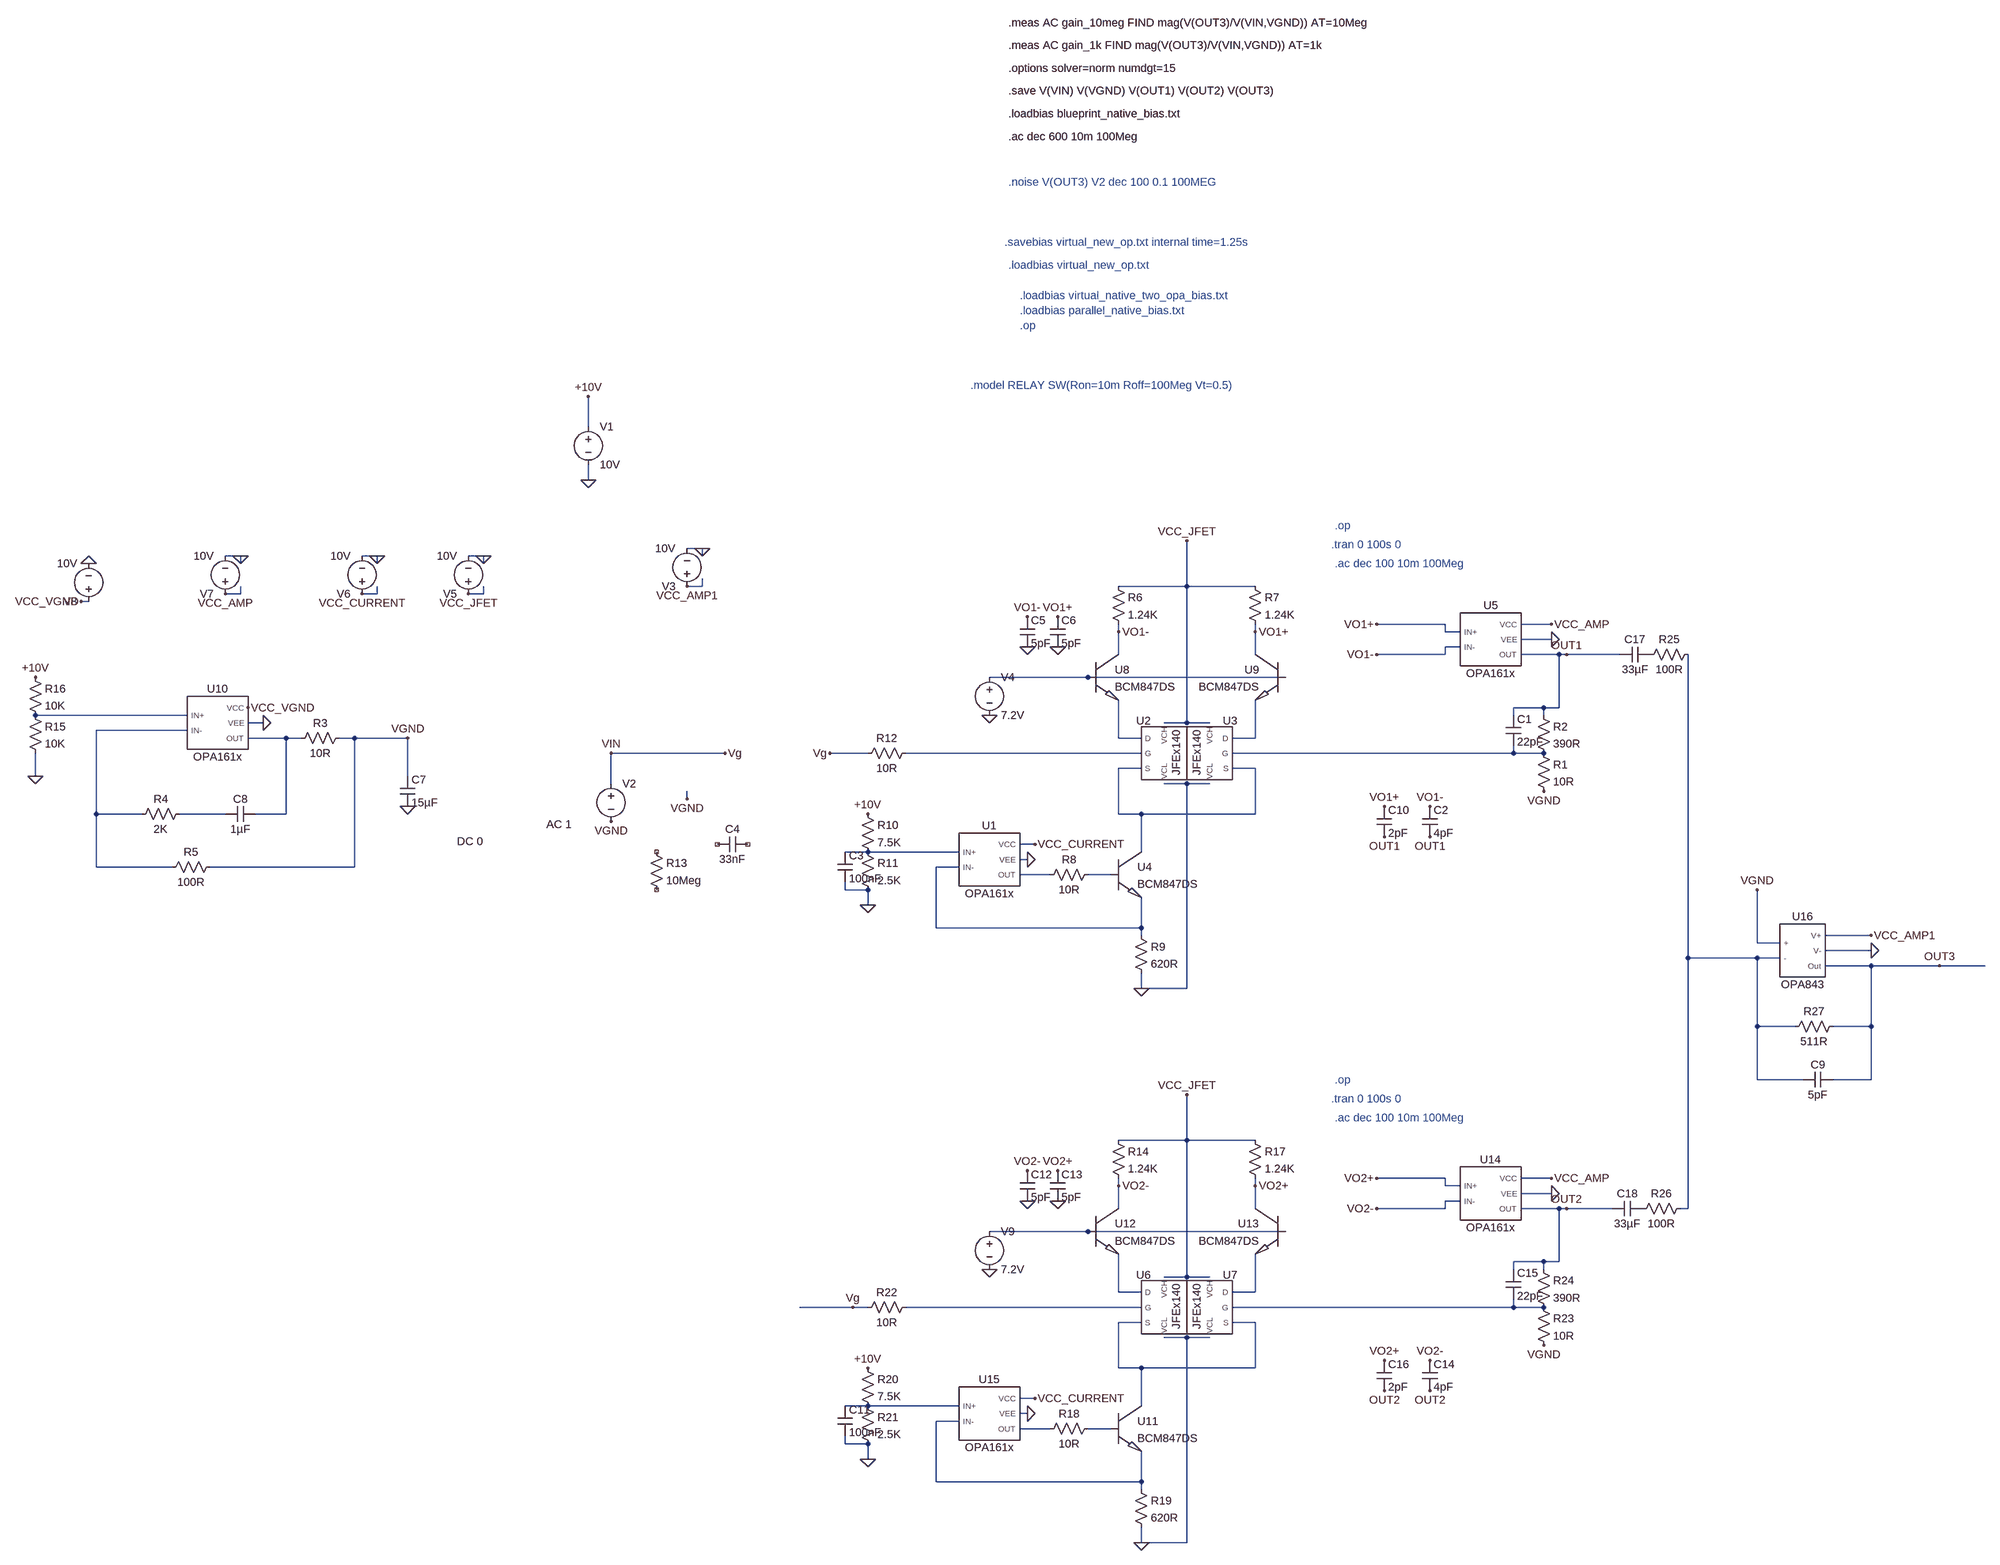
[diagram p0: schematic blueprint_bias_AC.asc]
blueprint_bias_AC.asc, the LTspice schematic file:
Version 4.1
SHEET 1 1684 2100
WIRE -1888 -272 -1888 -336
WIRE -1888 -160 -1888 -192
WIRE -1648 -16 -1680 -16
WIRE -2704 0 -2736 0
WIRE -2416 0 -2448 0
WIRE -2192 0 -2224 0
WIRE -1648 0 -1648 -16
WIRE -2704 16 -2704 0
WIRE -2416 16 -2416 0
WIRE -2192 16 -2192 0
WIRE -1648 64 -1648 48
WIRE -1648 64 -1680 64
WIRE -592 64 -592 -32
WIRE -592 64 -736 64
WIRE -448 64 -592 64
WIRE -2704 80 -2704 64
WIRE -2704 80 -2736 80
WIRE -2416 80 -2416 64
WIRE -2416 80 -2448 80
WIRE -2192 80 -2192 64
WIRE -2192 80 -2224 80
WIRE -3024 96 -3040 96
WIRE -48 144 -192 144
WIRE 176 144 112 144
WIRE -736 160 -736 144
WIRE -448 160 -448 144
WIRE -48 160 -48 144
WIRE -16 160 -48 160
WIRE 176 176 112 176
WIRE -16 192 -48 192
WIRE -736 208 -736 160
WIRE -448 208 -448 160
WIRE -48 208 -48 192
WIRE -48 208 -192 208
WIRE 192 208 112 208
WIRE 208 208 192 208
WIRE 320 208 208 208
WIRE -800 256 -1008 256
WIRE -384 256 -800 256
WIRE 160 320 96 320
WIRE 192 320 192 208
WIRE 192 320 160 320
WIRE -2816 336 -3136 336
WIRE 96 336 96 320
WIRE 160 336 160 320
WIRE -2656 352 -2688 352
WIRE -592 352 -592 64
WIRE -592 352 -640 352
WIRE -544 352 -592 352
WIRE -2816 368 -3008 368
WIRE -2608 384 -2688 384
WIRE -2576 384 -2608 384
WIRE -2464 384 -2496 384
WIRE -2352 384 -2464 384
WIRE -736 384 -736 304
WIRE -688 384 -736 384
WIRE -448 384 -448 304
WIRE -448 384 -496 384
WIRE -1600 416 -1840 416
WIRE -1264 416 -1344 416
WIRE -688 416 -1184 416
WIRE 96 416 96 400
WIRE 96 416 -496 416
WIRE 160 416 96 416
WIRE -688 448 -736 448
WIRE -448 448 -496 448
WIRE -3136 464 -3136 416
WIRE -2352 464 -2352 384
WIRE -1840 480 -1840 416
WIRE -592 480 -640 480
WIRE -544 480 -592 480
WIRE -1680 512 -1680 496
WIRE -3008 544 -3008 368
WIRE -2912 544 -3008 544
WIRE -2736 544 -2832 544
WIRE -2608 544 -2608 384
WIRE -2608 544 -2672 544
WIRE -736 544 -736 448
WIRE -688 544 -736 544
WIRE -448 544 -448 448
WIRE -448 544 -688 544
WIRE -912 608 -944 608
WIRE -1264 624 -1312 624
WIRE -1072 624 -1264 624
WIRE -688 624 -688 544
WIRE -928 640 -944 640
WIRE -3008 656 -3008 544
WIRE -2848 656 -3008 656
WIRE -2464 656 -2464 384
WIRE -2464 656 -2768 656
WIRE -1072 656 -1120 656
WIRE -880 672 -944 672
WIRE -752 672 -800 672
WIRE -1312 704 -1312 688
WIRE -1264 704 -1312 704
WIRE -1264 736 -1264 704
WIRE -1120 784 -1120 656
WIRE -688 784 -688 720
WIRE -688 784 -1120 784
WIRE -688 800 -688 784
WIRE 896 800 800 800
WIRE 656 816 656 704
WIRE 704 816 656 816
WIRE 896 832 800 832
WIRE 464 848 464 208
WIRE 656 848 464 848
WIRE 704 848 656 848
WIRE 896 864 800 864
WIRE 1040 864 896 864
WIRE 1136 864 1040 864
WIRE -688 912 -688 880
WIRE -592 912 -592 480
WIRE -592 912 -688 912
WIRE 656 992 656 848
WIRE 736 992 656 992
WIRE 896 992 896 864
WIRE 896 992 816 992
WIRE 656 1104 656 992
WIRE 752 1104 656 1104
WIRE 896 1104 896 992
WIRE 896 1104 816 1104
WIRE -592 1232 -592 1136
WIRE -592 1232 -736 1232
WIRE -448 1232 -592 1232
WIRE -48 1312 -192 1312
WIRE 176 1312 112 1312
WIRE -736 1328 -736 1312
WIRE -448 1328 -448 1312
WIRE -48 1328 -48 1312
WIRE -16 1328 -48 1328
WIRE 176 1344 112 1344
WIRE -16 1360 -48 1360
WIRE -736 1376 -736 1328
WIRE -448 1376 -448 1328
WIRE -48 1376 -48 1360
WIRE -48 1376 -192 1376
WIRE 192 1376 112 1376
WIRE 208 1376 192 1376
WIRE 304 1376 208 1376
WIRE 464 1376 464 848
WIRE 464 1376 448 1376
WIRE -800 1424 -1008 1424
WIRE -384 1424 -800 1424
WIRE 160 1488 96 1488
WIRE 192 1488 192 1376
WIRE 192 1488 160 1488
WIRE 96 1504 96 1488
WIRE 160 1504 160 1488
WIRE -592 1520 -592 1232
WIRE -592 1520 -640 1520
WIRE -544 1520 -592 1520
WIRE -736 1552 -736 1472
WIRE -688 1552 -736 1552
WIRE -448 1552 -448 1472
WIRE -448 1552 -496 1552
WIRE -1296 1584 -1408 1584
WIRE -1264 1584 -1296 1584
WIRE -688 1584 -1184 1584
WIRE 96 1584 96 1568
WIRE 96 1584 -496 1584
WIRE 160 1584 96 1584
WIRE -688 1616 -736 1616
WIRE -448 1616 -496 1616
WIRE -592 1648 -640 1648
WIRE -544 1648 -592 1648
WIRE -736 1712 -736 1616
WIRE -688 1712 -736 1712
WIRE -448 1712 -448 1616
WIRE -448 1712 -688 1712
WIRE -912 1776 -944 1776
WIRE -1264 1792 -1312 1792
WIRE -1072 1792 -1264 1792
WIRE -688 1792 -688 1712
WIRE -928 1808 -944 1808
WIRE -1072 1824 -1120 1824
WIRE -880 1840 -944 1840
WIRE -752 1840 -800 1840
WIRE -1312 1872 -1312 1856
WIRE -1264 1872 -1312 1872
WIRE -1264 1904 -1264 1872
WIRE -1120 1952 -1120 1824
WIRE -688 1952 -688 1888
WIRE -688 1952 -1120 1952
WIRE -688 1968 -688 1952
WIRE -688 2080 -688 2048
WIRE -592 2080 -592 1648
WIRE -592 2080 -688 2080
FLAG -1888 -160 0
FLAG -1888 -336 +10V
FLAG -688 912 0
FLAG -1264 736 0
FLAG -1264 544 +10V
FLAG -928 640 0
FLAG -736 160 VO1-
FLAG -448 160 VO1+
FLAG -1680 512 VGND
FLAG -1840 416 VIN
FLAG -928 128 VO1-
FLAG -928 192 0
FLAG -864 128 VO1+
FLAG -864 192 0
FLAG -1008 336 0
FLAG -192 208 VO1-
FLAG -192 144 VO1+
FLAG -80 528 VO1-
FLAG 208 208 OUT1
FLAG -80 592 OUT1
FLAG 176 176 0
FLAG 160 496 VGND
FLAG 176 144 VCC_AMP
FLAG -2736 80 VCC_AMP
FLAG -2448 80 VCC_CURRENT
FLAG -2224 80 VCC_JFET
FLAG -592 -32 VCC_JFET
FLAG -912 608 VCC_CURRENT
FLAG -2704 0 0
FLAG -2416 0 0
FLAG -2192 0 0
FLAG -1840 560 VGND
FLAG -2352 528 0
FLAG -3040 96 VCC_VGND
FLAG -3024 16 0
FLAG -2688 320 VCC_VGND
FLAG -2656 352 0
FLAG -3136 464 0
FLAG -3136 256 +10V
FLAG -176 592 OUT1
FLAG -176 528 VO1+
FLAG -688 2080 0
FLAG -1264 1904 0
FLAG -1264 1712 +10V
FLAG -928 1808 0
FLAG -736 1328 VO2-
FLAG -448 1328 VO2+
FLAG -1296 1584 Vg
FLAG -928 1296 VO2-
FLAG -928 1360 0
FLAG -864 1296 VO2+
FLAG -864 1360 0
FLAG -1008 1504 0
FLAG -192 1376 VO2-
FLAG -192 1312 VO2+
FLAG -80 1696 VO2-
FLAG 208 1376 OUT2
FLAG -80 1760 OUT2
FLAG 176 1344 0
FLAG 160 1664 VGND
FLAG 176 1312 VCC_AMP
FLAG -592 1136 VCC_JFET
FLAG -912 1776 VCC_CURRENT
FLAG -176 1760 OUT2
FLAG -176 1696 VO2+
FLAG -1600 416 Vg
FLAG -1344 416 Vg
FLAG 656 704 VGND
FLAG 896 832 0
FLAG 1040 864 OUT3
FLAG -1680 64 VCC_AMP1
FLAG -1648 -16 0
FLAG 896 800 VCC_AMP1
FLAG -2352 384 VGND
SYMBOL voltage -1888 -288 R0
WINDOW 123 0 0 Left 0
WINDOW 39 0 0 Left 0
SYMATTR InstName V1
SYMATTR Value 10V
SYMBOL JFEx140 -640 416 R0
SYMATTR InstName U2
SYMBOL JFEx140 -544 416 M0
SYMATTR InstName U3
SYMBOL res -752 48 R0
SYMATTR InstName R6
SYMATTR Value 1.24K
SYMBOL res -464 48 R0
SYMATTR InstName R7
SYMATTR Value 1.24K
SYMBOL BCM847DS -752 624 R0
SYMATTR InstName U4
SYMBOL res -784 656 R90
WINDOW 0 0 56 VBottom 2
WINDOW 3 32 56 VTop 2
SYMATTR InstName R8
SYMATTR Value 10R
SYMBOL res -704 784 R0
SYMATTR InstName R9
SYMATTR Value 620R
SYMBOL res -1280 528 R0
SYMATTR InstName R10
SYMATTR Value 7.5K
SYMBOL res -1280 608 R0
SYMATTR InstName R11
SYMATTR Value 2.5K
SYMBOL cap -1328 624 R0
SYMATTR InstName C3
SYMATTR Value 100nF
SYMBOL res -1168 400 R90
WINDOW 0 0 56 VBottom 2
WINDOW 3 32 56 VTop 2
SYMATTR InstName R12
SYMATTR Value 10R
SYMBOL voltage -1840 464 R0
WINDOW 3 -408 138 Left 2
WINDOW 123 -136 102 Left 2
WINDOW 39 0 0 Left 0
SYMATTR Value DC 0
SYMATTR Value2 AC 1
SYMATTR InstName V2
SYMBOL cap -1552 592 R90
WINDOW 0 0 32 VBottom 2
WINDOW 3 32 32 VTop 2
SYMATTR InstName C4
SYMATTR Value 33nF
SYMATTR SpiceLine V=5V
SYMBOL res -1760 608 R0
SYMATTR InstName R13
SYMATTR Value 10Meg
SYMBOL cap -944 128 R0
SYMATTR InstName C5
SYMATTR Value 5pF
SYMBOL cap -880 128 R0
SYMATTR InstName C6
SYMATTR Value 5pF
SYMBOL BCM847DS -800 208 R0
SYMATTR InstName U8
SYMBOL BCM847DS -384 208 M0
SYMATTR InstName U9
SYMBOL voltage -1008 240 R0
WINDOW 123 0 0 Left 0
WINDOW 39 0 0 Left 0
SYMATTR InstName V4
SYMATTR Value 7.2V
SYMBOL OPA161x 48 176 R0
SYMATTR InstName U5
SYMBOL cap -96 528 R0
SYMATTR InstName C2
SYMATTR Value 4pF
SYMBOL res 144 400 R0
SYMATTR InstName R1
SYMATTR Value 10R
SYMBOL res 144 320 R0
SYMATTR InstName R2
SYMATTR Value 390R
SYMBOL cap 80 336 R0
SYMATTR InstName C1
SYMATTR Value 22pF
SYMBOL OPA161x -1008 640 R0
SYMATTR InstName U1
SYMBOL OPA161x -2752 352 R0
SYMATTR InstName U10
SYMBOL res -2480 368 R90
WINDOW 0 0 56 VBottom 2
WINDOW 3 32 56 VTop 2
SYMATTR InstName R3
SYMATTR Value 10R
SYMBOL cap -2368 464 R0
SYMATTR InstName C7
SYMATTR Value 15µF
SYMATTR SpiceLine Rser=10mR Lser=1nH
SYMBOL cap -2672 528 R90
WINDOW 0 0 32 VBottom 2
WINDOW 3 32 32 VTop 2
SYMATTR InstName C8
SYMATTR Value 1µF
SYMBOL res -2816 528 R90
WINDOW 0 0 56 VBottom 2
WINDOW 3 32 56 VTop 2
SYMATTR InstName R4
SYMATTR Value 2K
SYMBOL res -2752 640 R90
WINDOW 0 0 56 VBottom 2
WINDOW 3 32 56 VTop 2
SYMATTR InstName R5
SYMATTR Value 100R
SYMBOL res -3152 320 R0
SYMATTR InstName R15
SYMATTR Value 10K
SYMBOL res -3152 240 R0
SYMATTR InstName R16
SYMATTR Value 10K
SYMBOL cap -192 528 R0
SYMATTR InstName C10
SYMATTR Value 2pF
SYMBOL JFEx140 -640 1584 R0
SYMATTR InstName U6
SYMBOL JFEx140 -544 1584 M0
SYMATTR InstName U7
SYMBOL res -752 1216 R0
SYMATTR InstName R14
SYMATTR Value 1.24K
SYMBOL res -464 1216 R0
SYMATTR InstName R17
SYMATTR Value 1.24K
SYMBOL BCM847DS -752 1792 R0
SYMATTR InstName U11
SYMBOL res -784 1824 R90
WINDOW 0 0 56 VBottom 2
WINDOW 3 32 56 VTop 2
SYMATTR InstName R18
SYMATTR Value 10R
SYMBOL res -704 1952 R0
SYMATTR InstName R19
SYMATTR Value 620R
SYMBOL res -1280 1696 R0
SYMATTR InstName R20
SYMATTR Value 7.5K
SYMBOL res -1280 1776 R0
SYMATTR InstName R21
SYMATTR Value 2.5K
SYMBOL cap -1328 1792 R0
SYMATTR InstName C11
SYMATTR Value 100nF
SYMBOL res -1168 1568 R90
WINDOW 0 0 56 VBottom 2
WINDOW 3 32 56 VTop 2
SYMATTR InstName R22
SYMATTR Value 10R
SYMBOL cap -944 1296 R0
SYMATTR InstName C12
SYMATTR Value 5pF
SYMBOL cap -880 1296 R0
SYMATTR InstName C13
SYMATTR Value 5pF
SYMBOL BCM847DS -800 1376 R0
SYMATTR InstName U12
SYMBOL BCM847DS -384 1376 M0
SYMATTR InstName U13
SYMBOL voltage -1008 1408 R0
WINDOW 123 0 0 Left 0
WINDOW 39 0 0 Left 0
SYMATTR InstName V9
SYMATTR Value 7.2V
SYMBOL OPA161x 48 1344 R0
SYMATTR InstName U14
SYMBOL cap -96 1696 R0
SYMATTR InstName C14
SYMATTR Value 4pF
SYMBOL res 144 1568 R0
SYMATTR InstName R23
SYMATTR Value 10R
SYMBOL res 144 1488 R0
SYMATTR InstName R24
SYMATTR Value 390R
SYMBOL cap 80 1504 R0
SYMATTR InstName C15
SYMATTR Value 22pF
SYMBOL OPA161x -1008 1808 R0
SYMATTR InstName U15
SYMBOL cap -192 1696 R0
SYMATTR InstName C16
SYMATTR Value 2pF
SYMBOL cap 384 192 R90
WINDOW 0 0 32 VBottom 2
WINDOW 3 32 32 VTop 2
SYMATTR InstName C17
SYMATTR Value 33µF
SYMBOL res 480 192 R90
WINDOW 0 0 56 VBottom 2
WINDOW 3 32 56 VTop 2
SYMATTR InstName R25
SYMATTR Value 100R
SYMBOL cap 368 1360 R90
WINDOW 0 0 32 VBottom 2
WINDOW 3 32 32 VTop 2
SYMATTR InstName C18
SYMATTR Value 33µF
SYMBOL res 464 1360 R90
WINDOW 0 0 56 VBottom 2
WINDOW 3 32 56 VTop 2
SYMATTR InstName R26
SYMATTR Value 100R
SYMBOL res 832 976 R90
WINDOW 0 0 56 VBottom 2
WINDOW 3 32 56 VTop 2
SYMATTR InstName R27
SYMATTR Value 511R
SYMBOL voltage -1680 80 R180
WINDOW 123 0 0 Left 0
WINDOW 39 0 0 Left 0
SYMATTR InstName V3
SYMATTR Value 10V
SYMBOL voltage -2224 96 R180
WINDOW 123 0 0 Left 0
WINDOW 39 0 0 Left 0
SYMATTR InstName V5
SYMATTR Value 10V
SYMBOL voltage -2448 96 R180
WINDOW 123 0 0 Left 0
WINDOW 39 0 0 Left 0
SYMATTR InstName V6
SYMATTR Value 10V
SYMBOL voltage -2736 96 R180
WINDOW 123 0 0 Left 0
WINDOW 39 0 0 Left 0
SYMATTR InstName V7
SYMATTR Value 10V
SYMBOL voltage -3024 112 R180
WINDOW 123 0 0 Left 0
WINDOW 39 0 0 Left 0
SYMATTR InstName V8
SYMATTR Value 10V
SYMBOL OPA843 752 832 R0
SYMATTR InstName U16
SYMBOL cap 816 1088 R90
WINDOW 0 0 32 VBottom 2
WINDOW 3 32 32 VTop 2
SYMATTR InstName C9
SYMATTR Value 5pF
TEXT -280 16 Left 2 ;.ac dec 100 10m 100Meg
TEXT -288 -24 Left 2 ;.tran 0 100s 0
TEXT -280 -64 Left 2 ;.op
TEXT -976 -688 Left 2 ;.savebias virtual_new_op.txt internal time=1.25s
TEXT -968 -640 Left 2 ;.loadbias virtual_new_op.txt
TEXT -944 -512 Left 2 ;.op
TEXT -944 -576 Left 2 ;.loadbias virtual_native_two_opa_bias.txt
TEXT -1048 -360 Left 2 ;.model RELAY SW(Ron=10m Roff=100Meg Vt=0.5)
TEXT -968 -840 Left 2 ;.noise V(OUT3) V2 dec 100 0.1 100MEG
TEXT -944 -544 Left 2 ;.loadbias parallel_native_bias.txt
TEXT -280 1184 Left 2 ;.ac dec 100 10m 100Meg
TEXT -288 1144 Left 2 ;.tran 0 100s 0
TEXT -280 1104 Left 2 ;.op
TEXT -968 -936 Left 2 !.ac dec 600 10m 100Meg
TEXT -968 -984 Left 2 !.loadbias blueprint_native_bias.txt
TEXT -968 -1032 Left 2 !.save V(VIN) V(VGND) V(OUT1) V(OUT2) V(OUT3)
TEXT -968 -1080 Left 2 !.options solver=norm numdgt=15
TEXT -968 -1128 Left 2 !.meas AC gain_1k FIND mag(V(OUT3)/V(VIN,VGND)) AT=1k
TEXT -968 -1176 Left 2 !.meas AC gain_10meg FIND mag(V(OUT3)/V(VIN,VGND)) AT=10Meg

The netlist it stands for:
* blueprint_bias_AC.asc
V1 +10V 0 10V
X§U2 N005 N007 N009 VCC_JFET 0 JFEx140  ; pins D G S VCH VCL
X§U3 N006 N008 N009 VCC_JFET 0 JFEx140  ; pins D G S VCH VCL
R6 VCC_JFET VO1- 1.24K
R7 VCC_JFET VO1+ 1.24K
X§U4 N009 N014 N012 BCM847DS  ; pins C B E
R8 N014 N013 10R
R9 N012 0 620R
R10 +10V N011 7.5K
R11 N011 0 2.5K
C3 N011 0 100nF
R12 N007 Vg 10R
V2 Vg VGND DC 0 AC 1
C4 NC_01 NC_02 33nF V=5V
R13 NC_03 NC_04 10Meg
C5 VO1- 0 5pF
C6 VO1+ 0 5pF
X§U8 VO1- N001 N005 BCM847DS  ; pins C B E
X§U9 VO1+ N001 N006 BCM847DS  ; pins C B E
V4 N001 0 7.2V
X§U5 VO1+ VO1- VCC_AMP 0 OUT1 OPA161x  ; pins IN+ IN- VCC VEE OUT
C2 VO1- OUT1 4pF
R1 N008 VGND 10R
R2 OUT1 N008 390R
C1 OUT1 N008 22pF
X§U1 N011 N012 VCC_CURRENT 0 N013 OPA161x  ; pins IN+ IN- VCC VEE OUT
X§U10 N002 N003 VCC_VGND 0 N004 OPA161x  ; pins IN+ IN- VCC VEE OUT
R3 VGND N004 10R
C7 VGND 0 15µF Rser=10mR Lser=1nH
C8 N004 N010 1µF
R4 N010 N003 2K
R5 VGND N003 100R
R15 N002 0 10K
R16 +10V N002 10K
C10 VO1+ OUT1 2pF
X§U6 N017 N019 N021 VCC_JFET 0 JFEx140  ; pins D G S VCH VCL
X§U7 N018 N020 N021 VCC_JFET 0 JFEx140  ; pins D G S VCH VCL
R14 VCC_JFET VO2- 1.24K
R17 VCC_JFET VO2+ 1.24K
X§U11 N021 N025 N023 BCM847DS  ; pins C B E
R18 N025 N024 10R
R19 N023 0 620R
R20 +10V N022 7.5K
R21 N022 0 2.5K
C11 N022 0 100nF
R22 N019 Vg 10R
C12 VO2- 0 5pF
C13 VO2+ 0 5pF
X§U12 VO2- N016 N017 BCM847DS  ; pins C B E
X§U13 VO2+ N016 N018 BCM847DS  ; pins C B E
V9 N016 0 7.2V
X§U14 VO2+ VO2- VCC_AMP 0 OUT2 OPA161x  ; pins IN+ IN- VCC VEE OUT
C14 VO2- OUT2 4pF
R23 N020 VGND 10R
R24 OUT2 N020 390R
C15 OUT2 N020 22pF
X§U15 N022 N023 VCC_CURRENT 0 N024 OPA161x  ; pins IN+ IN- VCC VEE OUT
C16 VO2+ OUT2 2pF
C17 P001 OUT1 33µF
R25 N015 P001 100R
C18 P002 OUT2 33µF
R26 N015 P002 100R
R27 OUT3 N015 511R
V3 VCC_AMP1 0 10V
V5 VCC_JFET 0 10V
V6 VCC_CURRENT 0 10V
V7 VCC_AMP 0 10V
V8 VCC_VGND 0 10V
X§U16 VGND N015 VCC_AMP1 0 OUT3 OPA843  ; pins + - V+ V- Out
C9 OUT3 N015 5pF
* .ac dec 100 10m 100Meg
* .tran 0 100s 0
* .op
* .savebias virtual_new_op.txt internal time=1.25s
* .loadbias virtual_new_op.txt
* .op
* .loadbias virtual_native_two_opa_bias.txt
* .model RELAY SW(Ron=10m Roff=100Meg Vt=0.5)
* .noise V(OUT3) V2 dec 100 0.1 100MEG
* .loadbias parallel_native_bias.txt
* .ac dec 100 10m 100Meg
* .tran 0 100s 0
* .op
.ac dec 600 10m 100Meg
.loadbias blueprint_native_bias.txt
.save V(VIN) V(VGND) V(OUT1) V(OUT2) V(OUT3)
.options solver=norm numdgt=15
.meas AC gain_1k FIND mag(V(OUT3)/V(VIN,VGND)) AT=1k
.meas AC gain_10meg FIND mag(V(OUT3)/V(VIN,VGND)) AT=10Meg
.lib jfex140.lib
.lib BCM847.lib
.lib OPA161x.LIB
.lib OPA843_LT2410.lib
.backanno
.end